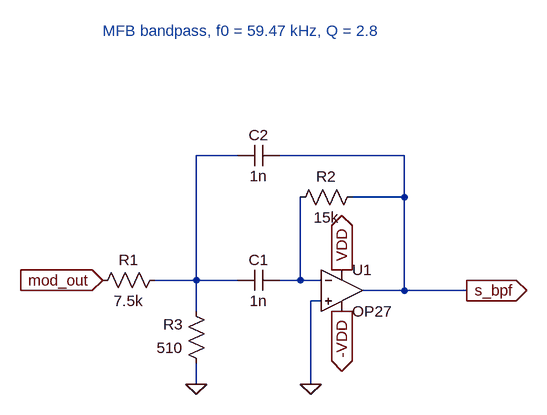
[diagram p0: schematic Band_Pass_Filter.asc]
Band_Pass_Filter.asc, the LTspice schematic file:
Version 4.1
SHEET 1 2756 680
WIRE 48 -480 -16 -480
WIRE 304 -480 112 -480
WIRE 304 -416 304 -480
WIRE 304 -416 224 -416
WIRE -16 -288 -16 -480
WIRE -16 -288 -80 -288
WIRE 48 -288 -16 -288
WIRE 144 -288 144 -416
WIRE 144 -288 112 -288
WIRE 176 -288 144 -288
WIRE 304 -272 304 -416
WIRE 304 -272 240 -272
WIRE 400 -272 304 -272
WIRE 176 -256 160 -256
WIRE -16 -240 -16 -288
WIRE -16 -128 -16 -160
WIRE 160 -128 160 -256
FLAG -16 -128 0
FLAG 160 -128 0
FLAG 400 -272 s_bpf
IOPIN 400 -272 Out
FLAG 208 -304 VDD
IOPIN 208 -304 Out
FLAG 208 -240 -VDD
IOPIN 208 -240 Out
FLAG -160 -288 mod_out
IOPIN -160 -288 In
SYMBOL OpAmps\\OP27 208 -336 R0
SYMATTR InstName U1
SYMBOL cap 112 -304 R90
WINDOW 0 0 32 VBottom 2
WINDOW 3 32 32 VTop 2
SYMATTR InstName C1
SYMATTR Value 1n
SYMBOL cap 112 -496 R90
WINDOW 0 0 32 VBottom 2
WINDOW 3 32 32 VTop 2
SYMATTR InstName C2
SYMATTR Value 1n
SYMBOL res -64 -304 R90
WINDOW 0 0 56 VBottom 2
WINDOW 3 32 56 VTop 2
SYMATTR InstName R1
SYMATTR Value 7.5k
SYMBOL res 240 -432 R90
WINDOW 0 0 56 VBottom 2
WINDOW 3 32 56 VTop 2
SYMATTR InstName R2
SYMATTR Value 15k
SYMBOL res 0 -144 R180
WINDOW 0 36 76 Left 2
WINDOW 3 36 40 Left 2
SYMATTR InstName R3
SYMATTR Value 510
TEXT -160 -672 Left 2 ;MFB bandpass, f0 = 59.47 kHz, Q = 2.8

The netlist it stands for:
* Band_Pass_Filter.asc
X§U1 0 N002 VDD -VDD s_bpf OP27  ; pins In+ In- V+ V- OUT
C1 N002 N001 1n
C2 s_bpf N001 1n
R1 N001 mod_out 7.5k
R2 s_bpf N002 15k
R3 0 N001 510
* MFB bandpass, f0 = 59.47 kHz, Q = 2.8
.lib ADI.lib
.backanno
.end